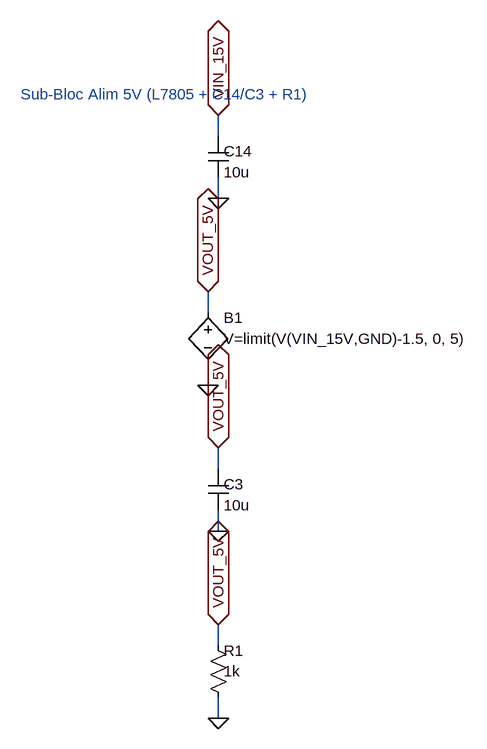
[diagram p0: schematic sub_alim_5v.asc]
sub_alim_5v.asc, the LTspice schematic file:
Version 4
SHEET 1 3200 2400
TEXT 32 32 Left 2 ;Sub-Bloc Alim 5V (L7805 + C14/C3 + R1)
SYMBOL cap 320 96 R0
WINDOW 0 24 24 Left 2
WINDOW 3 24 56 Left 2
SYMATTR InstName C14
SYMATTR Value 10u
WIRE 336 96 336 64
FLAG 336 64 VIN_15V
IOPIN 336 64 BiDir
WIRE 336 160 336 192
FLAG 336 192 0
IOPIN 336 192 BiDir
SYMBOL bv 320 352 R0
WINDOW 0 24 24 Left 2
WINDOW 3 24 56 Left 2
SYMATTR InstName B1
SYMATTR Value V=limit(V(VIN_15V,GND)-1.5, 0, 5)
WIRE 320 368 320 336
FLAG 320 336 VOUT_5V
IOPIN 320 336 BiDir
WIRE 320 448 320 480
FLAG 320 480 0
IOPIN 320 480 BiDir
SYMBOL cap 320 608 R0
WINDOW 0 24 24 Left 2
WINDOW 3 24 56 Left 2
SYMATTR InstName C3
SYMATTR Value 10u
WIRE 336 608 336 576
FLAG 336 576 VOUT_5V
IOPIN 336 576 BiDir
WIRE 336 672 336 704
FLAG 336 704 0
IOPIN 336 704 BiDir
SYMBOL res 320 864 R0
WINDOW 0 24 24 Left 2
WINDOW 3 24 56 Left 2
SYMATTR InstName R1
SYMATTR Value 1k
WIRE 336 880 336 848
FLAG 336 848 VOUT_5V
IOPIN 336 848 BiDir
WIRE 336 960 336 992
FLAG 336 992 0
IOPIN 336 992 BiDir

The netlist it stands for:
* sub_alim_5v.asc
C14 VIN_15V 0 10u
B1 VOUT_5V 0 V=limit(V(VIN_15V,GND)-1.5, 0, 5)
C3 VOUT_5V 0 10u
R1 VOUT_5V 0 1k
* Sub-Bloc Alim 5V (L7805 + C14/C3 + R1)
.backanno
.end